# Altium schematic sheet DDR3_Memory.SchDoc
size A4; SheetNumber: 12; SheetTotal: 13
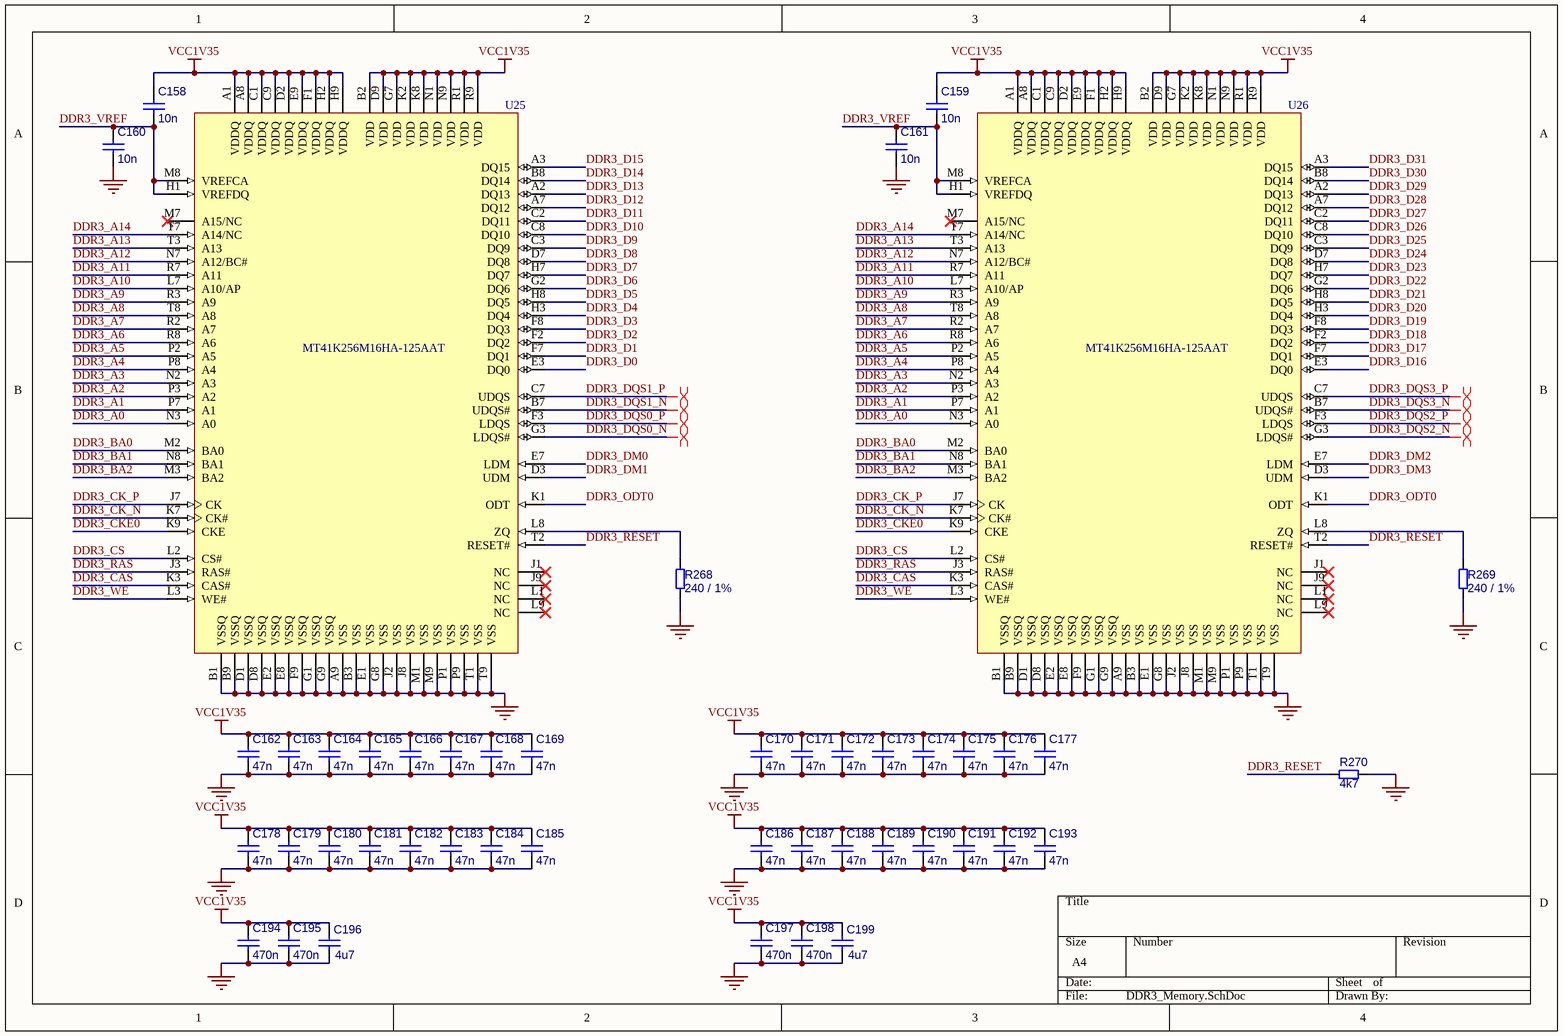
[diagram p0: DDR3_Memory.SchDoc]

## Parts
C158  10n  [CAPC1005X50N_0402]
C159  10n  [CAPC1005X50N_0402]
C160  10n  [CAPC1005X50N_0402]
C161  10n  [CAPC1005X50N_0402]
C162  47n  [CAPC1005X50N_0402]
C163  47n  [CAPC1005X50N_0402]
C164  47n  [CAPC1005X50N_0402]
C165  47n  [CAPC1005X50N_0402]
C166  47n  [CAPC1005X50N_0402]
C167  47n  [CAPC1005X50N_0402]
C168  47n  [CAPC1005X50N_0402]
C169  47n  [CAPC1005X50N_0402]
C170  47n  [CAPC1005X50N_0402]
C171  47n  [CAPC1005X50N_0402]
C172  47n  [CAPC1005X50N_0402]
C173  47n  [CAPC1005X50N_0402]
C174  47n  [CAPC1005X50N_0402]
C175  47n  [CAPC1005X50N_0402]
C176  47n  [CAPC1005X50N_0402]
C177  47n  [CAPC1005X50N_0402]
C178  47n  [CAPC1005X50N_0402]
C179  47n  [CAPC1005X50N_0402]
C180  47n  [CAPC1005X50N_0402]
C181  47n  [CAPC1005X50N_0402]
C182  47n  [CAPC1005X50N_0402]
C183  47n  [CAPC1005X50N_0402]
C184  47n  [CAPC1005X50N_0402]
C185  47n  [CAPC1005X50N_0402]
C186  47n  [CAPC1005X50N_0402]
C187  47n  [CAPC1005X50N_0402]
C188  47n  [CAPC1005X50N_0402]
C189  47n  [CAPC1005X50N_0402]
C190  47n  [CAPC1005X50N_0402]
C191  47n  [CAPC1005X50N_0402]
C192  47n  [CAPC1005X50N_0402]
C193  47n  [CAPC1005X50N_0402]
C194  470n  [CAPC1005X50N_0402]
C195  470n  [CAPC1005X50N_0402]
C196  4u7  [C_0805]
C197  470n  [CAPC1005X50N_0402]
C198  470n  [CAPC1005X50N_0402]
C199  4u7  [C_0805]
R268  240 / 1%  [R_0402]
R269  240 / 1%  [R_0402]
R270  4k7  [R_0402]
U25  MT41K256M16HA-125AAT  [MICT-HA-96]
U26  MT41K256M16HA-125AAT  [MICT-HA-96]

## Nets
GND: C160.1 C161.1 C162.1 C163.1 C164.1 C165.1 C166.1 C167.1 C168.1 C169.1 C170.1 C171.1 C172.1 C173.1 C174.1 C175.1 C176.1 C177.1 C178.1 C179.1 C180.1 C181.1 C182.1 C183.1 C184.1 C185.1 C186.1 C187.1 C188.1 C189.1 C190.1 C191.1 C192.1 C193.1 C194.1 C195.1 C196.1 C197.1 C198.1 C199.1 R268.1 R269.1 R270.1 U25.A9(VSS) U25.B1(VSSQ) U25.B3(VSS) U25.B9(VSSQ) U25.D1(VSSQ) U25.D8(VSSQ) U25.E1(VSS) U25.E2(VSSQ) U25.E8(VSSQ) U25.F9(VSSQ) U25.G1(VSSQ) U25.G8(VSS) U25.G9(VSSQ) U25.J2(VSS) U25.J8(VSS) U25.M1(VSS) U25.M9(VSS) U25.P1(VSS) U25.P9(VSS) U25.T1(VSS) U25.T9(VSS) U26.A9(VSS) U26.B1(VSSQ) U26.B3(VSS) U26.B9(VSSQ) U26.D1(VSSQ) U26.D8(VSSQ) U26.E1(VSS) U26.E2(VSSQ) U26.E8(VSSQ) U26.F9(VSSQ) U26.G1(VSSQ) U26.G8(VSS) U26.G9(VSSQ) U26.J2(VSS) U26.J8(VSS) U26.M1(VSS) U26.M9(VSS) U26.P1(VSS) U26.P9(VSS) U26.T1(VSS) U26.T9(VSS)
VCC1V35: C158.2 C159.2 C162.2 C163.2 C164.2 C165.2 C166.2 C167.2 C168.2 C169.2 C170.2 C171.2 C172.2 C173.2 C174.2 C175.2 C176.2 C177.2 C178.2 C179.2 C180.2 C181.2 C182.2 C183.2 C184.2 C185.2 C186.2 C187.2 C188.2 C189.2 C190.2 C191.2 C192.2 C193.2 C194.2 C195.2 C196.2 C197.2 C198.2 C199.2 U25.A1(VDDQ) U25.A8(VDDQ) U25.B2(VDD) U25.C1(VDDQ) U25.C9(VDDQ) U25.D2(VDDQ) U25.D9(VDD) U25.E9(VDDQ) U25.F1(VDDQ) U25.G7(VDD) U25.H2(VDDQ) U25.H9(VDDQ) U25.K2(VDD) U25.K8(VDD) U25.N1(VDD) U25.N9(VDD) U25.R1(VDD) U25.R9(VDD) U26.A1(VDDQ) U26.A8(VDDQ) U26.B2(VDD) U26.C1(VDDQ) U26.C9(VDDQ) U26.D2(VDDQ) U26.D9(VDD) U26.E9(VDDQ) U26.F1(VDDQ) U26.G7(VDD) U26.H2(VDDQ) U26.H9(VDDQ) U26.K2(VDD) U26.K8(VDD) U26.N1(VDD) U26.N9(VDD) U26.R1(VDD) U26.R9(VDD)
DDR3_A0: U25.N3(A0) U26.N3(A0)
DDR3_A1: U25.P7(A1) U26.P7(A1)
DDR3_A2: U25.P3(A2) U26.P3(A2)
DDR3_A3: U25.N2(A3) U26.N2(A3)
DDR3_A4: U25.P8(A4) U26.P8(A4)
DDR3_A5: U25.P2(A5) U26.P2(A5)
DDR3_A6: U25.R8(A6) U26.R8(A6)
DDR3_A7: U25.R2(A7) U26.R2(A7)
DDR3_A8: U25.T8(A8) U26.T8(A8)
DDR3_A9: U25.R3(A9) U26.R3(A9)
DDR3_A10: U25.L7(A10/AP) U26.L7(A10/AP)
DDR3_A11: U25.R7(A11) U26.R7(A11)
DDR3_A12: U25.N7(A12/BC#) U26.N7(A12/BC#)
DDR3_A13: U25.T3(A13) U26.T3(A13)
DDR3_A14: U25.T7(A14/NC) U26.T7(A14/NC)
DDR3_BA0: U25.M2(BA0) U26.M2(BA0)
DDR3_BA1: U25.N8(BA1) U26.N8(BA1)
DDR3_BA2: U25.M3(BA2) U26.M3(BA2)
DDR3_CAS: U25.K3(CAS#) U26.K3(CAS#)
DDR3_CK_N: U25.K7(CK#) U26.K7(CK#)
DDR3_CK_P: U25.J7(CK) U26.J7(CK)
DDR3_CKE0: U25.K9(CKE) U26.K9(CKE)
DDR3_CS: U25.L2(CS#) U26.L2(CS#)
DDR3_D0: U25.E3(DQ0)
DDR3_D1: U25.F7(DQ1)
DDR3_D2: U25.F2(DQ2)
DDR3_D3: U25.F8(DQ3)
DDR3_D4: U25.H3(DQ4)
DDR3_D5: U25.H8(DQ5)
DDR3_D6: U25.G2(DQ6)
DDR3_D7: U25.H7(DQ7)
DDR3_D8: U25.D7(DQ8)
DDR3_D9: U25.C3(DQ9)
DDR3_D10: U25.C8(DQ10)
DDR3_D11: U25.C2(DQ11)
DDR3_D12: U25.A7(DQ12)
DDR3_D13: U25.A2(DQ13)
DDR3_D14: U25.B8(DQ14)
DDR3_D15: U25.A3(DQ15)
DDR3_D16: U26.E3(DQ0)
DDR3_D17: U26.F7(DQ1)
DDR3_D18: U26.F2(DQ2)
DDR3_D19: U26.F8(DQ3)
DDR3_D20: U26.H3(DQ4)
DDR3_D21: U26.H8(DQ5)
DDR3_D22: U26.G2(DQ6)
DDR3_D23: U26.H7(DQ7)
DDR3_D24: U26.D7(DQ8)
DDR3_D25: U26.C3(DQ9)
DDR3_D26: U26.C8(DQ10)
DDR3_D27: U26.C2(DQ11)
DDR3_D28: U26.A7(DQ12)
DDR3_D29: U26.A2(DQ13)
DDR3_D30: U26.B8(DQ14)
DDR3_D31: U26.A3(DQ15)
DDR3_DM0: U25.E7(LDM)
DDR3_DM1: U25.D3(UDM)
DDR3_DM2: U26.E7(LDM)
DDR3_DM3: U26.D3(UDM)
DDR3_DQS0_N: U25.G3(LDQS#)
DDR3_DQS0_P: U25.F3(LDQS)
DDR3_DQS1_N: U25.B7(UDQS#)
DDR3_DQS1_P: U25.C7(UDQS)
DDR3_DQS2_N: U26.G3(LDQS#)
DDR3_DQS2_P: U26.F3(LDQS)
DDR3_DQS3_N: U26.B7(UDQS#)
DDR3_DQS3_P: U26.C7(UDQS)
DDR3_ODT0: U25.K1(ODT) U26.K1(ODT)
DDR3_RAS: U25.J3(RAS#) U26.J3(RAS#)
DDR3_RESET: R270.2 U25.T2(RESET#) U26.T2(RESET#)
DDR3_VREF: C158.1 C159.1 C160.2 C161.2 U25.H1(VREFDQ) U25.M8(VREFCA) U26.H1(VREFDQ) U26.M8(VREFCA)
DDR3_WE: U25.L3(WE#) U26.L3(WE#)
NetR268_2: R268.2 U25.L8(ZQ)
NetR269_2: R269.2 U26.L8(ZQ)

Not connected (* = marked no-connect by the designer): U25 J1(NC)* J9(NC)* L1(NC)* L9(NC)* M7(A15/NC)*; U26 J1(NC)* J9(NC)* L1(NC)* L9(NC)* M7(A15/NC)*

## Layout directives
differential pair: DDR3_DQS0_N, DDR3_DQS0_P, DDR3_DQS1_N, DDR3_DQS1_P, DDR3_DQS2_N, DDR3_DQS2_P, DDR3_DQS3_N, DDR3_DQS3_P

## Library data of the parts
C158-C195 C197 C198 = CMP-001-00084-2: MLCC 0402
C196 C199 = CMP-001-00086-2: MLCC 0805
R268-R270 = CMP-009-00178-3: Chip 0402 resistor
U25 U26 = CMP-019-00061-1: DDR3L Dram, 256MX16, Cmos, PBGA96; Max Supply Voltage: 1.45V; Min Supply Voltage: 1.283V; Case/Package: TFBGA